# Altium project altium.PrjPcb
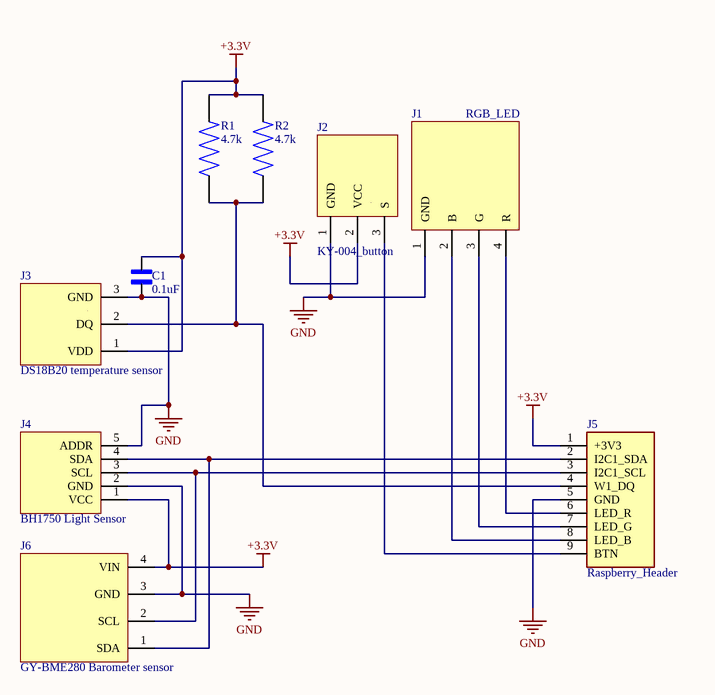
[diagram p0: RPi5_Sensor_Carrier.SchDoc]
1 sheet, 9 parts. Net scope: global (net labels, ports and power ports of the same name join across sheets).
Board file: RPi5_Sensor_Carrier.PcbDoc

## Sheet RPi5_Sensor_Carrier.SchDoc
size A; SheetNumber: 1; SheetTotal: 1

### Parts
C1  0.1uF  [CAP_RAD_2.54mm]
J1  RGB_LED  [J_RGB_LED]
J2  KY-004_button  [J_button]
J3  DS18B20 temperature sensor  [J_DS18B20]
J4  BH1750 Light Sensor  [J_GY-302]
J5  Raspberry_Header  [J_Raspberry_Header]
J6  GY-BME280 Barometer sensor  [J_GY-BME280]
R1  4.7k  [RES_AXIAL_0.25W_P7.62mm]
R2  4.7k  [RES_AXIAL_0.25W_P7.62mm]

### Nets
+3.3V: C1.2 J2.2(VCC) J3.1(VDD) J4.1(VCC) J5.1(+3V3) J6.4(VIN) R1.2 R2.2
GND: C1.1 J1.1(GND) J2.1(GND) J3.3(GND) J4.2(GND) J4.5(ADDR) J5.5(GND) J6.3(GND)
NetJ1_2: J1.2(B) J5.8(LED_B)
NetJ1_3: J1.3(G) J5.7(LED_G)
NetJ1_4: J1.4(R) J5.6(LED_R)
NetJ2_3: J2.3(S) J5.9(BTN)
NetJ3_2: J3.2(DQ) J5.4(W1_DQ) R1.1 R2.1
NetJ4_3: J4.3(SCL) J5.3(I2C1_SCL) J6.2(SCL)
NetJ4_4: J4.4(SDA) J5.2(I2C1_SDA) J6.1(SDA)

### Library data of the parts
C1 = CAP
J3 = DS18B20
J4 = GY-302_BH1750
J6 = GY-BME280
R1 R2 = RES